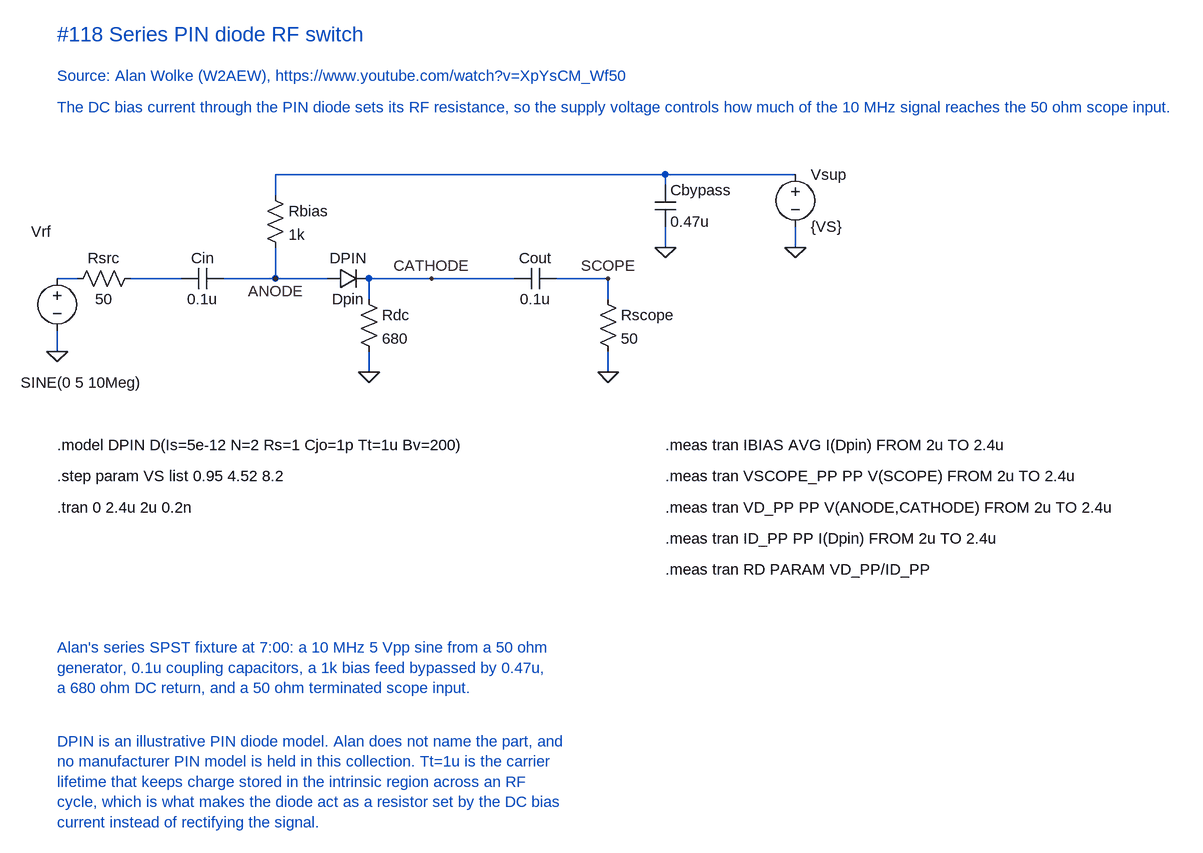
[diagram p0: schematic Series PIN diode switch.asc]
Series PIN diode switch.asc, the LTspice schematic file:
Version 4.1
SHEET 1 1400 1000
WIRE 96 0 64 0
WIRE 256 0 176 0
WIRE 400 0 320 0
WIRE 480 0 400 0
WIRE 768 0 544 0
WIRE 912 0 832 0
WIRE 64 112 64 80
WIRE 400 -48 400 0
WIRE 400 -160 400 -128
WIRE 1200 -160 400 -160
WIRE 1000 -160 1000 -144
WIRE 1000 -48 1000 -80
WIRE 1200 -48 1200 -80
WIRE 544 32 544 0
WIRE 544 144 544 112
WIRE 912 32 912 0
WIRE 912 144 912 112
FLAG 64 112 0
FLAG 400 0 ANODE
FLAG 640 0 CATHODE
FLAG 912 0 SCOPE
FLAG 544 144 0
FLAG 912 144 0
FLAG 1000 -48 0
FLAG 1200 -48 0
SYMBOL voltage 64 -16 R0
WINDOW 0 -40 -56 Left 2
WINDOW 3 -56 176 Left 2
SYMATTR InstName Vrf
SYMATTR Value SINE(0 5 10Meg)
SYMBOL res 192 -16 R90
WINDOW 0 0 56 VBottom 2
WINDOW 3 32 56 VTop 2
SYMATTR InstName Rsrc
SYMATTR Value 50
SYMBOL cap 320 -16 R90
WINDOW 0 0 32 VBottom 2
WINDOW 3 32 32 VTop 2
SYMATTR InstName Cin
SYMATTR Value 0.1u
SYMBOL res 384 -144 R0
SYMATTR InstName Rbias
SYMATTR Value 1k
SYMBOL diode 480 16 R270
WINDOW 0 0 32 VBottom 2
WINDOW 3 32 32 VTop 2
SYMATTR InstName Dpin
SYMATTR Value DPIN
SYMBOL res 528 16 R0
SYMATTR InstName Rdc
SYMATTR Value 680
SYMBOL cap 832 -16 R90
WINDOW 0 0 32 VBottom 2
WINDOW 3 32 32 VTop 2
SYMATTR InstName Cout
SYMATTR Value 0.1u
SYMBOL res 896 16 R0
SYMATTR InstName Rscope
SYMATTR Value 50
SYMBOL cap 984 -144 R0
SYMATTR InstName Cbypass
SYMATTR Value 0.47u
SYMBOL voltage 1200 -176 R0
SYMATTR InstName Vsup
SYMATTR Value {VS}
TEXT 64 -376 Left 3 ;#118 Series PIN diode RF switch
TEXT 64 -312 Left 2 ;Source: Alan Wolke (W2AEW), https://www.youtube.com/watch?v=XpYsCM_Wf50
TEXT 64 -264 Left 2 ;The DC bias current through the PIN diode sets its RF resistance, so the supply voltage controls how much of the 10 MHz signal reaches the 50 ohm scope input.
TEXT 64 256 Left 2 !.model DPIN D(Is=5e-12 N=2 Rs=1 Cjo=1p Tt=1u Bv=200)
TEXT 64 304 Left 2 !.step param VS list 0.95 4.52 8.2
TEXT 64 352 Left 2 !.tran 0 2.4u 2u 0.2n
TEXT 64 568 Left 2 ;Alan's series SPST fixture at 7:00: a 10 MHz 5 Vpp sine from a 50 ohm\ngenerator, 0.1u coupling capacitors, a 1k bias feed bypassed by 0.47u,\na 680 ohm DC return, and a 50 ohm terminated scope input.
TEXT 64 712 Left 2 ;DPIN is an illustrative PIN diode model. Alan does not name the part, and\nno manufacturer PIN model is held in this collection. Tt=1u is the carrier\nlifetime that keeps charge stored in the intrinsic region across an RF\ncycle, which is what makes the diode act as a resistor set by the DC bias\ncurrent instead of rectifying the signal.
TEXT 1000 256 Left 2 !.meas tran IBIAS AVG I(Dpin) FROM 2u TO 2.4u
TEXT 1000 304 Left 2 !.meas tran VSCOPE_PP PP V(SCOPE) FROM 2u TO 2.4u
TEXT 1000 352 Left 2 !.meas tran VD_PP PP V(ANODE,CATHODE) FROM 2u TO 2.4u
TEXT 1000 400 Left 2 !.meas tran ID_PP PP I(Dpin) FROM 2u TO 2.4u
TEXT 1000 448 Left 2 !.meas tran RD PARAM VD_PP/ID_PP

The netlist it stands for:
* Series PIN diode switch.asc
Vrf N001 0 SINE(0 5 10Meg)
Rsrc N002 N001 50
Cin ANODE N002 0.1u
Rbias N003 ANODE 1k
Dpin ANODE CATHODE DPIN
Rdc CATHODE 0 680
Cout SCOPE CATHODE 0.1u
Rscope SCOPE 0 50
Cbypass N003 0 0.47u
Vsup N003 0 {VS}
.model D D
.lib standard.dio
* #118 Series PIN diode RF switch
* Source: Alan Wolke (W2AEW), https://www.youtube.com/watch?v=XpYsCM_Wf50
* The DC bias current through the PIN diode sets its RF resistance, so the supply voltage controls how much of the 10 MHz signal reaches the 50 ohm scope input.
.model DPIN D(Is=5e-12 N=2 Rs=1 Cjo=1p Tt=1u Bv=200)
.step param VS list 0.95 4.52 8.2
.tran 0 2.4u 2u 0.2n
* Alan's series SPST fixture at 7:00: a 10 MHz 5 Vpp sine from a 50 ohm
* generator, 0.1u coupling capacitors, a 1k bias feed bypassed by 0.47u,
* a 680 ohm DC return, and a 50 ohm terminated scope input.
* DPIN is an illustrative PIN diode model. Alan does not name the part, and
* no manufacturer PIN model is held in this collection. Tt=1u is the carrier
* lifetime that keeps charge stored in the intrinsic region across an RF
* cycle, which is what makes the diode act as a resistor set by the DC bias
* current instead of rectifying the signal.
.meas tran IBIAS AVG I(Dpin) FROM 2u TO 2.4u
.meas tran VSCOPE_PP PP V(SCOPE) FROM 2u TO 2.4u
.meas tran VD_PP PP V(ANODE,CATHODE) FROM 2u TO 2.4u
.meas tran ID_PP PP I(Dpin) FROM 2u TO 2.4u
.meas tran RD PARAM VD_PP/ID_PP
.backanno
.end